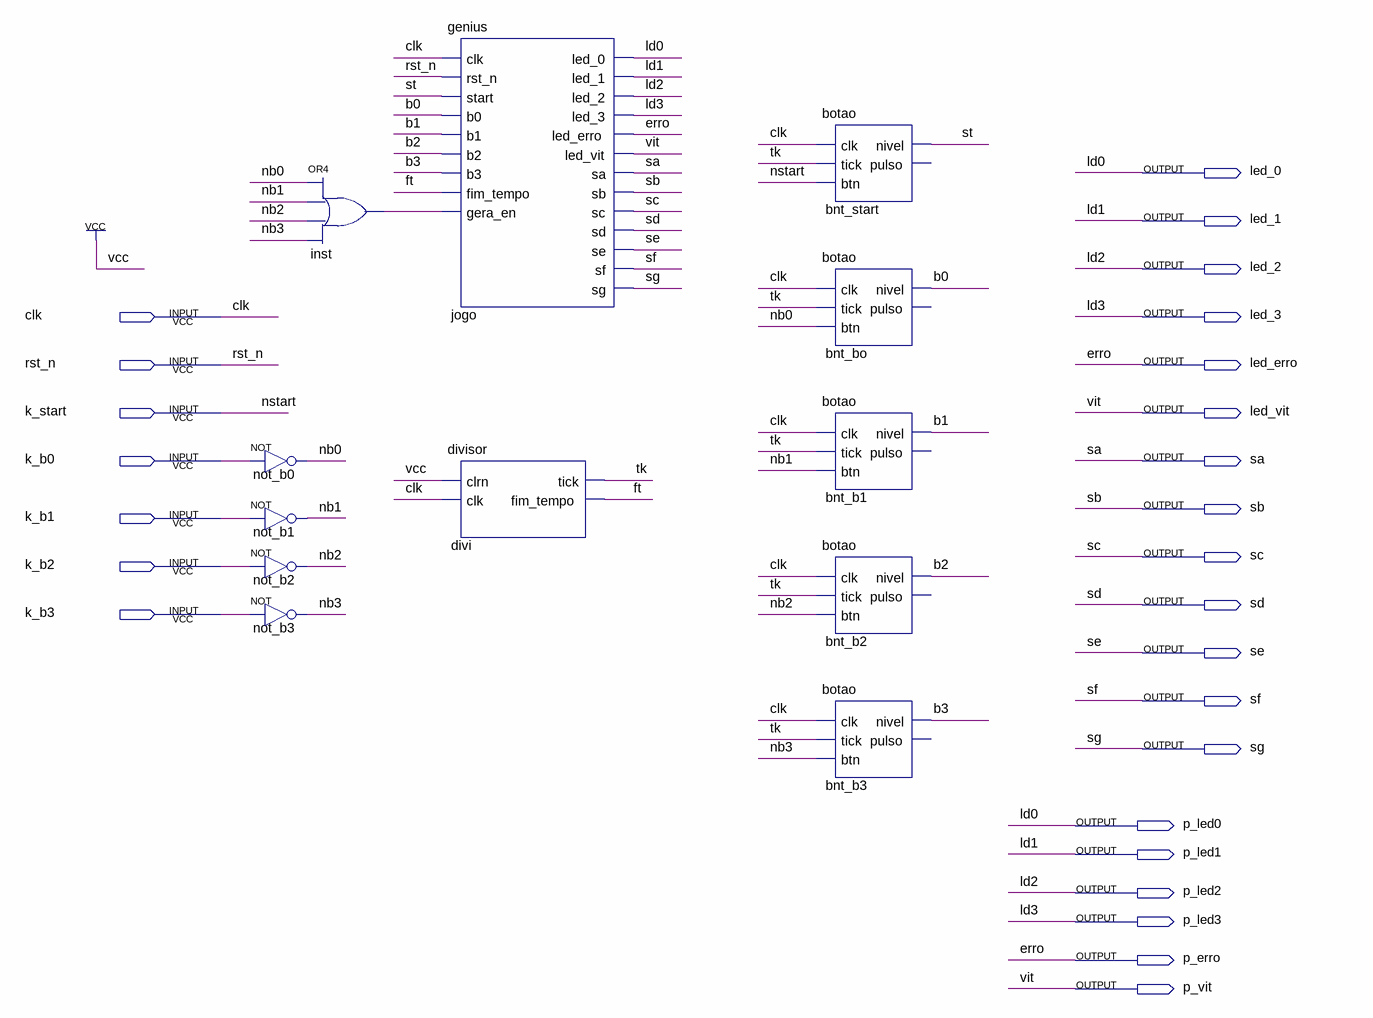
[diagram p0: schematic sheet]
// Quartus schematic genius_placa.bdf as structural Verilog: 12 symbols, 26 pins
module genius_placa (
  input  clk,
  input  rst_n,
  input  k_start,
  input  k_b0,
  input  k_b1,
  input  k_b2,
  input  k_b3,
  output led_0,
  output led_1,
  output led_2,
  output led_3,
  output led_erro,
  output led_vit,
  output sa,
  output sb,
  output sc,
  output sd,
  output se,
  output sf,
  output sg,
  output p_led0,
  output p_led1,
  output p_led2,
  output p_led3,
  output p_erro,
  output p_vit
);

  wire b0, b1, b2, b3, ft, inst_out, nb0, nb1, nb2, nb3, st, tk;

  not not_b0 (nb0, k_b0);
  not not_b1 (nb1, k_b1);
  not not_b2 (nb2, k_b2);
  not not_b3 (nb3, k_b3);
  or inst (inst_out, nb0, nb1, nb2, nb3);
  genius jogo (
    .clk(clk), .rst_n(rst_n), .start(st), .b0(b0), .b1(b1), .b2(b2), .b3(b3), .fim_tempo(ft),
    .gera_en(inst_out), .led_0(led_0), .led_1(led_1), .led_2(led_2), .led_3(led_3), .led_erro(led_erro),
    .led_vit(led_vit), .sa(sa), .sb(sb), .sc(sc), .sd(sd), .se(se), .sf(sf), .sg(sg));
  divisor divi (.clrn(1'b1), .clk(clk), .tick(tk), .fim_tempo(ft));
  botao bnt_start (.clk(clk), .tick(tk), .btn(k_start), .nivel(st));  // open: pulso
  botao bnt_bo (.clk(clk), .tick(tk), .btn(nb0), .nivel(b0));  // open: pulso
  botao bnt_b1 (.clk(clk), .tick(tk), .btn(nb1), .nivel(b1));  // open: pulso
  botao bnt_b2 (.clk(clk), .tick(tk), .btn(nb2), .nivel(b2));  // open: pulso
  botao bnt_b3 (.clk(clk), .tick(tk), .btn(nb3), .nivel(b3));  // open: pulso

  assign p_erro = led_erro;
  assign p_led0 = led_0;
  assign p_led1 = led_1;
  assign p_led2 = led_2;
  assign p_led3 = led_3;
  assign p_vit = led_vit;

  // Other names for the same wires on the sheet: erro = led_erro; ld0 = led_0; ld1 = led_1; ld2 = led_2; ld3 = led_3;
  //   nstart = k_start; vit = led_vit
endmodule
